# Altium schematic sheet 02_Display.SchDoc
size A4; SheetNumber: 2; SheetTotal: 6
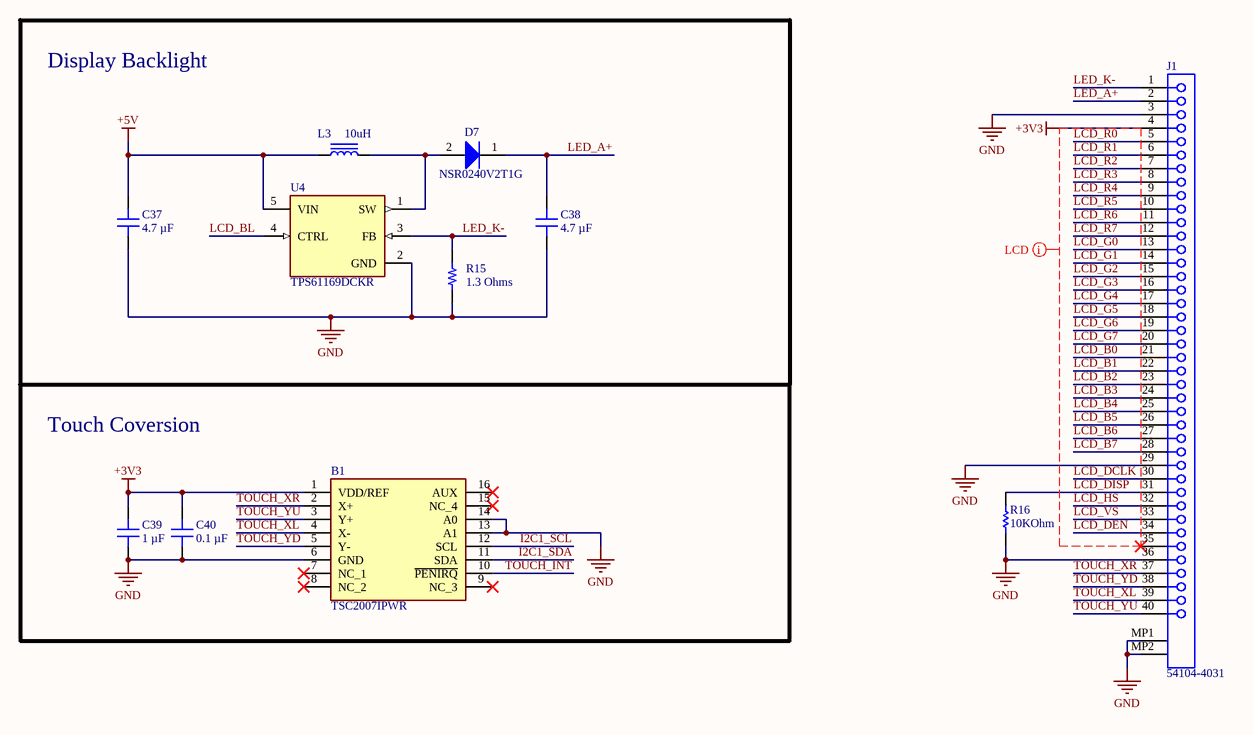
[diagram p0: 02_Display.SchDoc]

## Parts
B1  TSC2007IPWR  [SOP65P640X120-16N]
C37  4.7 µF  [CAP 0603_1608]
C38  4.7 µF  [CAP 1206_3216 - 0.8MM]
C39  1 µF  [CAP 0603_1608]
C40  0.1 µF  [CAP 0402_1005]
D7  NSR0240V2T1G  [ONSC-SOD-523-2-502-01_V]
J1  54104-4031  [MOLX-54104-4031]
L3  10uH  [CHK CKNR4018B-100MC INDP4040X180N]
R15  1.3 Ohms  [RES 0603_1608]
R16  10KOhm  [RESC1005X40X25LL05T05]
U4  TPS61169DCKR  [FP-DCK0005A-MFG]

## Nets
+3V3: B1.1(VDD/REF) C39.2 C40.2 J1.4
+5V: C37.2 L3.1 U4.5(VIN)
GND: B1.6(GND) B1.13(A1) B1.14(A0) C37.1 C38.1 C39.1 C40.1 J1.3 J1.29 J1.36 J1.MP1 J1.MP2 R15.1 R16.2 U4.2(GND)
I2C1_SCL: B1.12(SCL)
I2C1_SDA: B1.11(SDA)
LCD_B0: J1.21
LCD_B1: J1.22
LCD_B2: J1.23
LCD_B3: J1.24
LCD_B4: J1.25
LCD_B5: J1.26
LCD_B6: J1.27
LCD_B7: J1.28
LCD_BL: U4.4(CTRL)
LCD_DCLK: J1.30
LCD_DEN: J1.34
LCD_DISP: J1.31 R16.1
LCD_G0: J1.13
LCD_G1: J1.14
LCD_G2: J1.15
LCD_G3: J1.16
LCD_G4: J1.17
LCD_G5: J1.18
LCD_G6: J1.19
LCD_G7: J1.20
LCD_HS: J1.32
LCD_R0: J1.5
LCD_R1: J1.6
LCD_R2: J1.7
LCD_R3: J1.8
LCD_R4: J1.9
LCD_R5: J1.10
LCD_R6: J1.11
LCD_R7: J1.12
LCD_VS: J1.33
LED_A+: C38.2 D7.1(K) J1.2
LED_K-: J1.1 R15.2 U4.3(FB)
TOUCH_INT: B1.10(~{PENIRQ})
TOUCH_XL: B1.4(X-) J1.39
TOUCH_XR: B1.2(X+) J1.37
TOUCH_YD: B1.5(Y-) J1.38
TOUCH_YU: B1.3(Y+) J1.40
NetD7_2: D7.2(A) L3.2 U4.1(SW)

Not connected (* = marked no-connect by the designer): B1 7(NC_1)* 8(NC_2)* 9(NC_3)* 15(NC_4)* 16(AUX)*; J1 35*

## Layout directives
mark named LCD: +3V3, LCD_B0, LCD_B1, LCD_B2, LCD_B3, LCD_B4, LCD_B5, LCD_B6, LCD_B7, LCD_DCLK, LCD_DEN, LCD_DISP, LCD_G0, LCD_G1, LCD_G2, LCD_G3, LCD_G4, LCD_G5, LCD_G6, LCD_G7, LCD_HS, LCD_R0, LCD_R1, LCD_R2, LCD_R3, LCD_R4, LCD_R5, LCD_R6, LCD_R7, LCD_VS

## Notes on the sheet
- Display Backlight
- Touch Coversion

## Library data of the parts
B1 = TSC2007IPWR: TEXAS INSTRUMENTS - TSC2007IPWR - TOUCH SCREEN CONTROLLER, 12BIT, TSSOP-16; Geometry.Height: 1.2mm; Manufacturer_Name: Texas Instruments; Manufacturer_Part_Number: TSC2007IPWR; Mouser Part Number: 595-TSC2007IPWR; Mouser Price/Stock: https://www.mouser.co.uk/ProductDetail/Texas-Instruments/TSC2007IPWR?qs=6RlL8P85hLFwvOkF4fJ0jA%3D%3D; Arrow Part Number: TSC2007IPWR; Arrow Price/Stock: https://www.arrow.com/en/products/tsc2007ipwr/texas-instruments?region=nac; Datasheet Link: http://www.ti.com/lit/ds/symlink/tsc2007.pdf
C37 = CL10A475KP8NNNC: CAP CER 4.7UF 10V X5R 0603; Manufacturer: Samsung Electro-Mechanics; id: 830; Tolerance: ±10%; Part Number: CL10A475KP8NNNC; Value: 4.7 µF; Temperature Coefficient: X5R; Supplier Part Number 1: 1276-1044-1-ND; ComponentLink2Description: DigiKey Link; ComponentLink1URL: http://www.samsungsem.com/kr/support/product-search/mlcc/CL10A475KP8NNNC.jsp; PartId: 5671; Supplier 1: DigiKey; Series: CL; LastUpdated: 2023-01-03T20:07:38.840; Part Status: Active; Capacitance: 4.7 µF; Device Package: 0603 (1608 Metric); Thickness (Max): 0.035" (0.90mm); Voltage - Rated: 10V; Minimum Order: 1; Packaging: TapeAndReel; Applications: General Purpose; Package / Case: 0603 (1608 Metric); ComponentLink1Description: Datasheet; Price: 0.01; ComponentLink2URL: https://www.digikey.com/en/products/detail/samsung-electro-mechanics/CL10A475KP8NNNC/3886702; Lifecycle Status: Active; Operating Temperature: -55°C ~ 85°C; Size / Dimension: 0.063" L x 0.031" W (1.60mm x 0.80mm); Mounting Type: Surface Mount, MLCC
C38 = CL31B475KBHNNNE: CAP CER 4.7UF 50V X7R 1206; Manufacturer: Samsung Electro-Mechanics; id: 4450; Tolerance: ±10%; Part Number: CL31B475KBHNNNE; Value: 4.7 µF; Temperature Coefficient: X7R; Supplier Part Number 1: 1276-2789-1-ND; ComponentLink2Description: DigiKey Link; ComponentLink1URL: http://www.samsungsem.com/kr/support/product-search/mlcc/CL31B475KBHNNNE.jsp; PartId: 40975; Supplier 1: DigiKey; Series: CL; LastUpdated: 2023-01-03T20:13:11.760; Part Status: Active; Capacitance: 4.7 µF; Device Package: 1206 (3216 Metric); Thickness (Max): 0.071" (1.80mm); Voltage - Rated: 50V; Minimum Order: 1; Packaging: TapeAndReel; Applications: General Purpose; Package / Case: 1206 (3216 Metric); ComponentLink1Description: Datasheet; Price: 0.06; ComponentLink2URL: https://www.digikey.com/en/products/detail/samsung-electro-mechanics/CL31B475KBHNNNE/3888447; Lifecycle Status: Active; Operating Temperature: -55°C ~ 125°C; Size / Dimension: 0.126" L x 0.063" W (3.20mm x 1.60mm); Mounting Type: Surface Mount, MLCC
C39 = C0603C105K4RACAUTO: CAP CER 1UF 16V X7R 0603; Manufacturer: KEMET; id: 14; Tolerance: ±10%; Part Number: C0603C105K4RACAUTO; Value: 1 µF; Temperature Coefficient: X7R; Supplier Part Number 1: 399-17704-2-ND; ComponentLink2Description: DigiKey Link; ComponentLink1URL: https://api.kemet.com/component-edge/download/datasheet/C0603C105K4RACAUTO.pdf; PartId: 2179; Supplier 1: DigiKey; Series: SMD Auto X7R; LastUpdated: 2023-01-03T20:07:48.393; Part Status: Active; Capacitance: 1 µF; Device Package: 0603 (1608 Metric); Ratings: AEC-Q200; Thickness (Max): 0.037" (0.95mm); Voltage - Rated: 16V; Minimum Order: 0; Applications: Automotive, Bypass, Decoupling; Package / Case: 0603 (1608 Metric); ComponentLink1Description: Datasheet; Price: 0; ComponentLink2URL: https://www.digikey.com/en/products/detail/kemet/C0603C105K4RACAUTO/8635831; Lifecycle Status: Active; Operating Temperature: -55°C ~ 125°C; Size / Dimension: 0.063" L x 0.031" W (1.60mm x 0.80mm); Mounting Type: Surface Mount, MLCC
C40 = CL05B104KO5NNNC: CAP CER 0.1UF 16V X7R 0402; Manufacturer: Samsung Electro-Mechanics; id: 1479; Tolerance: ±10%; Part Number: CL05B104KO5NNNC; Value: 0.1 µF; Temperature Coefficient: X7R; Supplier Part Number 1: 1276-1001-1-ND; ComponentLink2Description: DigiKey Link; ComponentLink1URL: http://www.samsungsem.com/kr/support/product-search/mlcc/CL05B104KO5NNNC.jsp; PartId: 6066; Supplier 1: DigiKey; Series: CL; LastUpdated: 2023-01-03T20:04:06.380; Part Status: Active; Capacitance: 0.1 µF; Device Package: 0402 (1005 Metric); Thickness (Max): 0.022" (0.55mm); Voltage - Rated: 16V; Minimum Order: 1; Packaging: CutTape; Applications: General Purpose; Package / Case: 0402 (1005 Metric); ComponentLink1Description: Datasheet; Price: 0.01; ComponentLink2URL: https://www.digikey.com/en/products/detail/samsung-electro-mechanics/CL05B104KO5NNNC/3886659; Lifecycle Status: Active; Operating Temperature: -55°C ~ 125°C; Size / Dimension: 0.039" L x 0.020" W (1.00mm x 0.50mm); Mounting Type: Surface Mount, MLCC
D7 = CMP-1055-00485-1: Schottky Barrier Diode, 2-Pin SOD-523, Pb-Free, Tape and Reel; Manufacturer: On Semiconductor; Configuration: Single; IFSM Max (A): 2; PackageDescription: 2-Pin SOD, Body 1.2 x 0.8 mm; PackageVersion: Rev. E, 09/2010; ComponentLink2Description: Datasheet; DatasheetVersion: Rev. 2; PackageReference: SOD-523-2-502-01; Packing: Tape and Reel; Mounting Technology: Surface Mount; ComponentLink3URL: http://www.onsemi.com/pub_link/Collateral/502-01.PDF; RoHS: TRUE; ComponentLink1Description: Manufacturer URL; ComponentLink3Description: Package Specification; ComponentLink1URL: http://www.onsemi.com/; PartNumber: NSR0240V2T1G; ComponentLink2URL: http://www.onsemi.cn/pub_link/Collateral/NSR0240V2T1-D.PDF
J1 = CMP-1241-00508-1: 0.5 mm Pitch Easy-On(TM) Type FPC Connector, 2.0 mm Mated Height, Right Angle, ZIF, SMT, Top Contact, 40 Circuits, -20 to 85 degC, ELV and RoHS Compliant, Tape and Reel; Manufacturer: Molex; PCB Retention: Yes; Current (Max per Contact): 0.5A; Stackable: No; Durability (mating cycles max): 20; Pitch - Mating Interface: 0.50mm; Circuits (Loaded): 40; Mated Height: 2.00mm; Entry Angle: 90degrees Angle; Material - Metal: Phosphor Bronze; Voltage (Max): 50V; ComponentLink3URL: http://www.molex.com/pdm_docs/sd/541044031_sd.pdf; ComponentLink2URL: http://www.molex.com/webdocs/datasheets/pdf/en-us/0541044031_FFC_FPC_CONNECTORS.pdf; Number of Rows: 1; ComponentLink1Description: Manufacturer URL; ComponentLink2Description: Datasheet; Mounting Technology: Surface Mount; ComponentLink1URL: http://www.molex.com/molex/index.jsp; RoHS: TRUE; PackageReference: 54104-4031; Polarized to PCB: Yes; ComponentLink3Description: Package Specification; PackageVersion: Rev. F, 06/2012; PackageDescription: 40-Lead FPC Connector, Pitch 0.5 mm; Contact Position: Top; PCB Locator: No; PartNumber: 54104-4031; Orientation: Right Angle; Packing: Tape and Reel
L3 = CHK CKNR4018B-100MC: 2A 10uH ±20% 1.8A 180mΩ SMD,4x4mm Fixed Inductors RoHS; Value: 10uH
R15 = ERJ-3GEYJ1R3V: RES SMD 1.3 OHM 5% 1/10W 0603; Manufacturer: Panasonic Electronic Components; id: 9442; Temperature Coefficient: -100/ +600ppm/°C; Power (Watts): 0.1W, 1/10W; Part Number: ERJ-3GEYJ1R3V; Height - Seated (Max): 0.022" (0.55mm); Supplier Part Number 1: P1.3GCT-ND; Supplier Device Package: 0603; ComponentLink1Description: Datasheet; ComponentLink2URL: https://www.digikey.com/en/products/detail/panasonic-electronic-components/ERJ-3GEYJ1R3V/282114; Features: Automotive AEC-Q200; ComponentLink1URL: http://industrial.panasonic.com/www-cgi/jvcr13pz.cgi?E+PZ+3+AOA0001+ERJ3GEYJ1R3V+7+WW; Composition: Thick Film; Tolerance: ±5%; Supplier 1: DigiKey; Series: ERJ-3G; Part Status: Active; ComponentLink2Description: DigiKey Link; Device Package: 0603 (1608 Metric); Packaging: TapeAndReel; Ratings: AEC-Q200; Minimum Order: 1; Package / Case: 0603 (1608 Metric); PartId: 23240; Lifecycle Status: Active; LastUpdated: 2023-01-02T20:29:05.717; Operating Temperature: -55°C ~ 155°C; Number Of Terminations: 2; Value: 1.3 Ohms; Size / Dimension: 0.063" L x 0.031" W (1.60mm x 0.80mm); Price: 0.01; Resistance: 1.3 Ohms
R16 = CMP-2000-07588-1: Chip Resistor, 10 KOhm, +/- 1%, 0.1 W, -55 to 155 degC, 0402 (1005 Metric), RoHS, Tape and Reel; Manufacturer: Panasonic; Power Rating: 100mW; Voltage Rating: 50V; Case\/Package: 0402; Temperature Coefficient: 100ppm\/degreesC; RoHSCompliant: True; Lead Free: LeadFree; Package Quantity: 1; Contact Plating: Tin; Resistance: 10KOhm; Length: 1mm; Radiation Hardening: No; REACH SVHC: NoSVHC; Max Operating Temperature: 155degC; Depth: 0.5mm; Case Code (Imperial): 0402; Military Standard: Not; Package Description: 2-Pin Surface Mount Device, Body 1 x 0.5 mm; Termination: SMD/SMT; Case Code (Metric): 1005; Height: 0.35mm; Packaging: TapeandReel; Voltage Rating (DC): 50V; Package Reference: 402; Number of Pins: 2; Tolerance: 1%; Mounting Technology: SurfaceMount; Width: 0.02inch; Mount: SurfaceMount; Datasheet URL: https://industrial.panasonic.com/cdbs/www-data/pdf/RDA0000/AOA0000C304.pdf; Composition: ThickFilm; Datasheet Version: 02/2017; Manufacturer URL: http://www.panasonic.com/; Max Power Dissipation: 100mW; Number of Terminations: 2; Min Operating Temperature: -55degC
U4 = CMP-04914-000007-1: IC WLED BACKLIGHT DRIVER SC70-5; Manufacturer: Texas Instruments; Switching Frequency: 1.2MHz; Number Of Outputs: 1; Min Supply Voltage: 2.7V; Nominal Supply Current: 0.3mA; Dimming: PWM; Standoff Height: 0mm; Switching Topology: Boost; Max Supply Voltage: 5.5V; Max Junction Temp: +125°C; Temperature: -40°C to +85°C; Automotive: No; Octopart: https://octopart.com/tps61169dckr-texas+instruments-51890233; Device Class L2: Power Management ICs; ComponentLink2Description: Datasheet; Category: IC; Lead Free: Yes; Digikey Description: IC WLED BACKLIGHT DRIVER SC70-5; Device Class L1: Integrated Circuits (ICs); Temperature Range Low: -40°C; RoHS: TRUE; Mouser Description: LED Lighting Drivers TPS61169 38-VHighCur r Boost WLED Driver; Height: 1.1mm; Temperature Range High: +85°C; Device Class L3: LED Drivers; Manufacturer Part Number: TPS61169DCKR; Package: DCK0005A; ComponentLink2URL: https://www.ti.com/lit/ds/symlink/tps61169.pdf